# EAGLE design TA7358A (EAGLE 9.6.2)
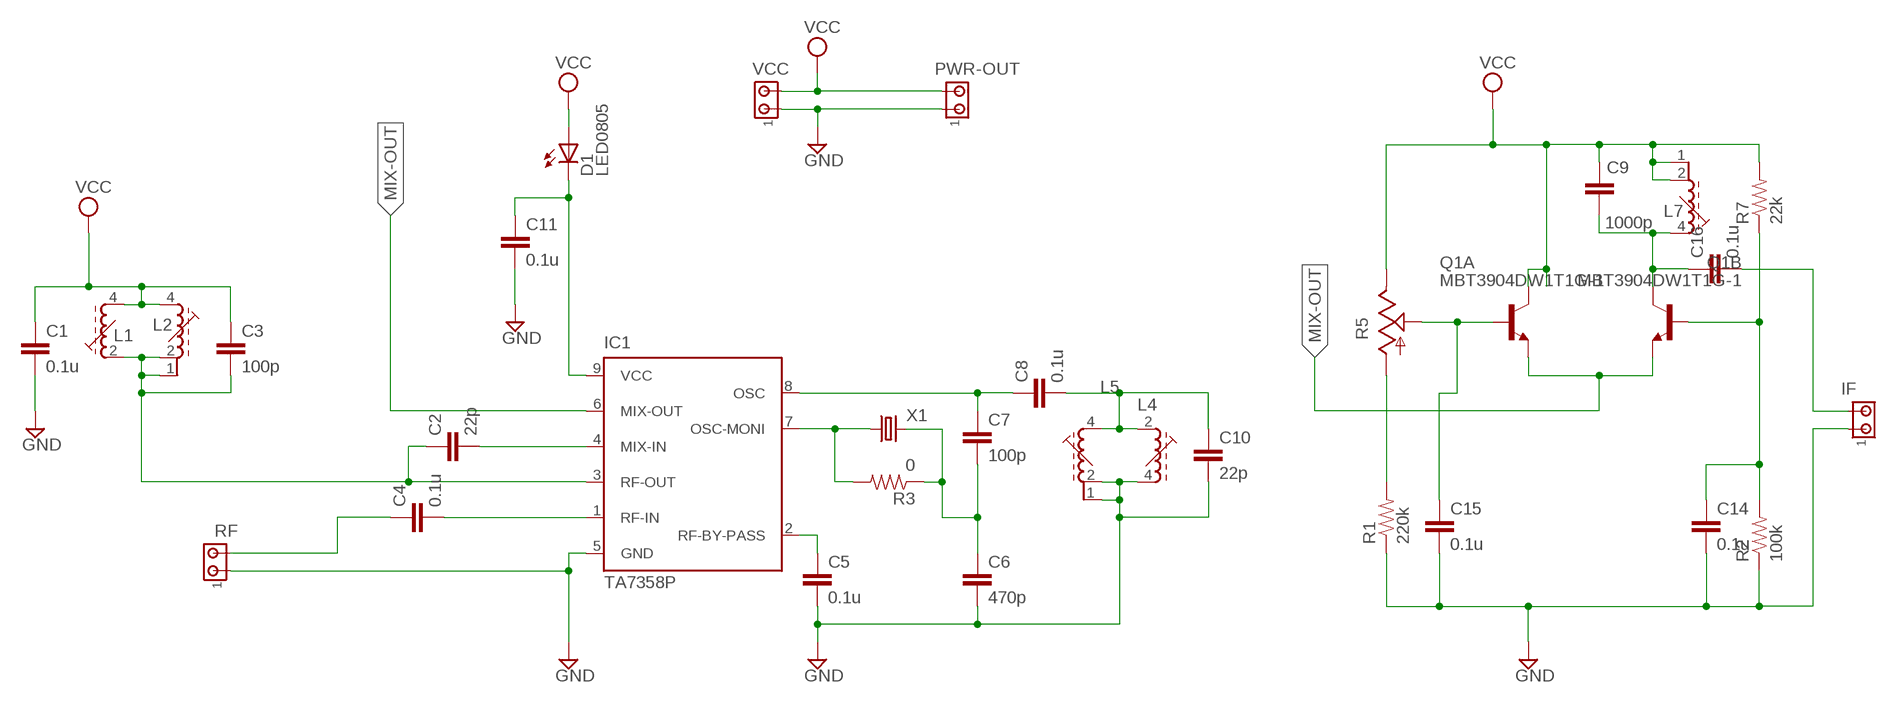
[diagram p0: schematic, sheet 1]

## Parts
C1  0.1u  CAPACITOR-NP0805  [0805]
C2  22p  CAPACITOR-NP0805  [0805]
C3  100p  CAPACITOR-NP0.2"  [CAP-0.2]
C4  0.1u  CAPACITOR-NP0805  [0805]
C5  0.1u  CAPACITOR-NP0805  [0805]
C6  470p  CAPACITOR-NP0.2"  [CAP-0.2]
C7  100p  CAPACITOR-NP0.2"  [CAP-0.2]
C8  0.1u  CAPACITOR-NP0805  [0805]
C9  1000p  CAPACITOR-NP0.2"  [CAP-0.2]
C10  22p  CAPACITOR-NP0.2"  [CAP-0.2]
C11  0.1u  CAPACITOR-NP0805  [0805]
C14  0.1u  CAPACITOR-NP0805  [0805]
C15  0.1u  CAPACITOR-NP0805  [0805]
C16  0.1u  CAPACITOR-NP0805  [0805]
D1  LED0805  [0805]
IC1  TA7358P  [SIP9-P-2.54A]
IF  BERG-2  [BERG-2]
L1  INDUCTOR-VAR-TOKO5K  [TOKO5K]
L2  INDUCTOR-VAR271K2  [71K2]
L4  INDUCTOR-VAR-TOKO5K  [TOKO5K]
L5  INDUCTOR-VAR271K2  [71K2]
L7  INDUCTOR-VAR271K2  [71K2]
PWR-OUT  BERG-2  [BERG-2]
Q1  MBT3904DW1T1G-1  [SOT363]
R1  220k  RESISTOR0805-RES  [0805]
R2  100k  RESISTOR0805-RES  [0805]
R3  0  RESISTOR0805-RES  [0805]
R5  100k  TRIMPOT-RM065  [RM-065]
R7  22k  RESISTOR0805-RES  [0805]
RF  BERG-2  [BERG-2]
VCC  BERG-2  [BERG-2]
X1  CRYSTALHC49S  [HC49/S]

## Nets
GND: C1.2 C5.2 C6.2 C10.2 C11.2 C14.2 C15.2 IC1.5(GND) IF.1 L4.4(E) L5.1(E1) L5.2(E) PWR-OUT.1 R1.1 R2.1 RF.1 VCC.1
MIX-OUT: IC1.6(MIX-OUT) Q1.1(B:E) Q1.4(A:E)
N$1: C2.2 IC1.4(MIX-IN)
N$2: C4.2 IC1.1(RF-IN)
N$3: C2.1 C3.2 IC1.3(RF-OUT) L1.2(A) L2.1(E1) L2.2(E)
N$5: C4.1 RF.2
N$6: C5.1 IC1.2(RF-BY-PASS)
N$7: C16.2 IF.2
N$8: C7.1 C8.1 IC1.8(OSC)
N$9: IC1.7(OSC-MONI) R3.2 X1.1
N$10: C6.1 C7.2 R3.1 X1.2
N$11: C14.1 Q1.2(B:B) R2.2 R7.1
N$12: R1.2 R5.CCW
N$13: C11.1 D1.1(C) IC1.9(VCC)
N$17: C9.2 C16.1 L7.4(A) Q1.6(B:C)
N$20: C15.1 Q1.5(A:B) R5.CT
VCC: C1.1 C3.1 C9.1 D1.2(A) L1.4(E) L2.4(A) L7.1(E1) L7.2(E) PWR-OUT.2 Q1.3(A:C) R5.CW R7.2 VCC.2
VCC1: C8.2 C10.1 L4.2(A) L5.4(A)

## Library data of the parts
C1-C11 C14-C16 = madhu:CAPACITOR-NP: Non-polarized capacitor 0.1", 0.2" leaded capacitor.
D1 = madhu:LED: LED
IC1 = linear:TA7358P: FM FRONT-END Source: TOSHIBA TA7358P.pdf
IF PWR-OUT RF VCC = madhu:BERG-2: Two pin Berg connector
L1 L4 = madhu:INDUCTOR-VAR: Variable inductors
L2 L5 L7 = madhu:INDUCTOR-VAR2: 7K and MC-122 combined inductor. Externally connect pins 1 and 2
Q1 = madhu:MBT3904DW1T1G: Dual NPN 150 mW, 300 MHz ft
R1-R3 R7 = madhu:RESISTOR: Resistor Basic schematic elements and footprints for 0603, 1206, and PTH resistors.
R5 = madhu:TRIMPOT: Trimer potentiometer
X1 = madhu:CRYSTAL: CRYSTAL; OC_FARNELL: 1667008; OC_NEWARK: unknown

## Board
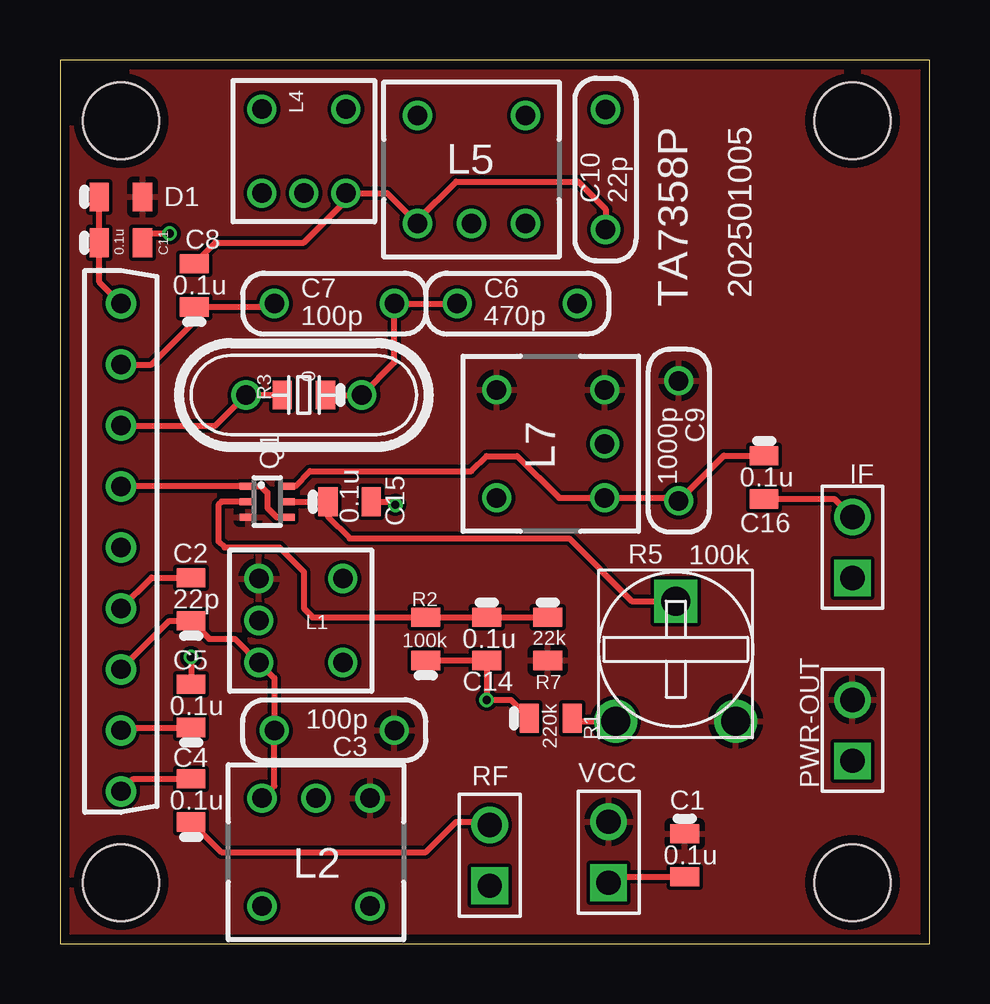
[diagram p1: board, top side]
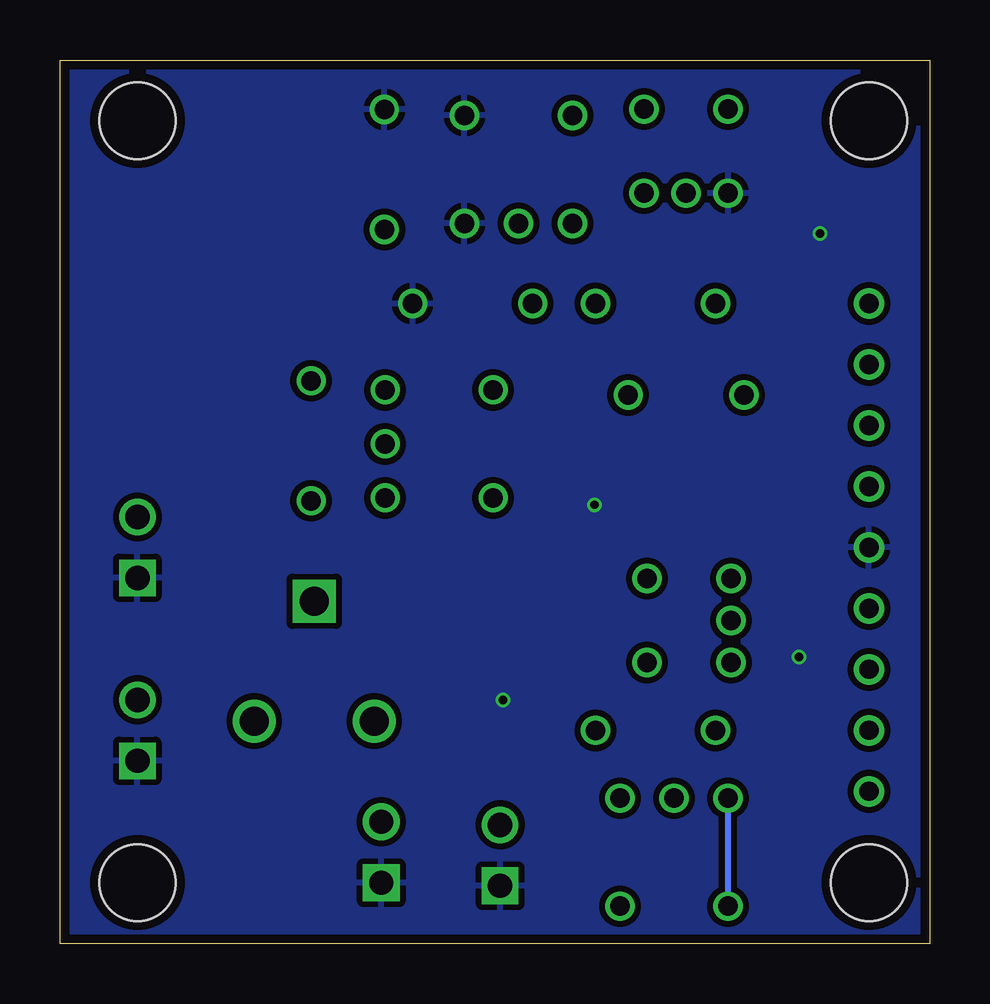
[diagram p2: board, bottom side, seen from below]

Size 36.25 x 36.82 mm. Coordinates in mm from the lower left corner, seen from the top.
Outline: 0,0 36.25,0 36.25,36.82 0,36.82 0,0
Copper layers (1*16): Top 0.035559375mm / dielectric 1.6mm / Bottom 0.035559375mm
Design rules "oshpark-2layer": minimum track width 6mil, minimum drill 10mil, track to track 6mil, track to pad 6mil, pad to pad 6mil, via to via 6mil, smd to smd 6mil, copper to edge 15mil, drill to drill 6mil, minimum pad ring 5mil, minimum via ring 5mil, stop-mask expansion 2.5mil, vias tented up to drill 0mil, thermal gap 10mil
Holes 3.17 mm at 2.54,2.54 33.02,2.54 2.54,34.29 33.02,34.29

### Footprints (pad centres in the part's own frame; a part is rotated, then mirrored left to right if it is on the bottom)
0805 = smd 0.8 x 1.2: 1 -0.9,0; 2 0.9,0
CAP-0.2 = drill 0.813: 1 -2.5,0; 2 2.5,0
SIP9-P-2.54A = drill 0.8 pad 1.27: 1 -10.16,0; 2 -7.62,0; 3 -5.08,0; 4 -2.54,0; 5 0,0; 6 2.54,0; 7 5.08,0; 8 7.62,0; 9 10.16,0
BERG-2 = drill 1.016 square: 1 -1.27,0 | drill 1.016: 2 1.27,0
TOKO5K = drill 0.813: 1 -1.75,1.75; 2 1.75,1.75; 3 1.75,0; 4 1.75,-1.75; 5 -1.75,-1.75
71K2 = drill 0.813: 1 -2.25,-2.25; 2 -2.25,2.25; 3 0,2.25; 4 2.25,2.25; 5 2.25,-2.25
SOT363 = smd 0.3 x 0.7: 1 -0.65,-0.8; 2 0,-0.8; 3 0.65,-0.8; 4 0.65,0.8; 5 0,0.8; 6 -0.65,0.8
RM-065 = drill 1.2: CCW -2.5,0; CW 2.5,0 | drill 1.2 square: CT 0,5
HC49/S = drill 0.813: 1 -2.413,0; 2 2.413,0

### Placement (x,y rotation side)
C1  26.04,3.68 270 top
C2  5.46,14.35 90 top
C3  11.43,8.89 180 top
C4  5.46,5.97 90 top
C5  5.46,9.91 90 top
C6  19.05,26.67 0 top
C7  11.43,26.67 0 top
C8  5.59,27.43 90 top
C9  25.78,20.95 270 top
C10  22.73,32.26 90 top
C11  2.54,29.21 0 top
C14  17.78,12.7 270 top
C15  12.06,18.41 0 top
C16  29.34,19.43 270 top
D1  2.54,31.11 0 top
IC1  2.54,16.51 90 top
IF  33.02,16.51 90 top
L1  10.03,13.46 180 top
L2  10.67,3.81 0 top
L4  10.16,33.02 270 top
L5  17.14,32.26 180 top
L7  20.45,20.83 270 top
PWR-OUT  33.02,8.89 90 top
Q1  8.64,18.41 270 top
R1  20.45,9.4 0 top
R2  15.24,12.7 90 top
R3  10.16,22.86 180 top
R5  25.65,9.27 0 top
R7  20.32,12.7 270 top
RF  17.91,3.68 90 top
VCC  22.86,3.81 90 top
X1  10.16,22.86 0 top

### Tracks (layer width: path | path; a pad name or v marks a point on that pad's centre or on a via)
GND  (via drill 0.35)
  Top 0.254: R2.1 C14.2 v17.78,10.16 18.79,10.16 R1.1 | VCC.1 23.1,2.78 C1.2 | v5.46,11.94 C5.2 | C11.2 3.82,29.59 v4.57,29.59 | C15.2 13.84,18.41 v13.97,18.29
  pour Bottom (isolate 0.254): 0,0 0,36.7 36.32,36.7 36.32,0
MIX-OUT
  Top 0.254: IC1.6 7.82,19.05 Q1.1 8.37,19.07 8.64,18.8 8.64,18.16 9.03,17.77 Q1.4
N$1
  Top 0.254: IC1.4 3.82,15.25 C2.2
N$2
  Top 0.254: IC1.1 3.06,6.87 C4.2
N$3
  Top 0.254: IC1.3 4.56,13.45 C2.1 6.21,12.7 7.29,12.7 L1.2 8.93,11.06 C3.2 8.93,6.57 L2.2
  Bottom 0.254: L2.2 L2.1
N$5
  Top 0.254: C4.1 6.72,3.81 15.24,3.81 16.51,5.08 17.78,5.08 RF.2
N$6
  Top 0.254: IC1.2 2.66,9.01 C5.1
N$7
  Top 0.254: C16.2 32.27,18.53 IF.2
N$8
  Top 0.254: IC1.8 3.81,24.13 5.59,25.91 C8.1 8.79,26.53 C7.1
N$9
  Top 0.254: IC1.7 6.48,21.59 X1.1 R3.2
N$10
  Top 0.254: C6.1 C7.2 13.93,24.22 X1.2 R3.1
N$11
  Top 0.254: Q1.2 6.73,18.41 6.6,18.29 6.6,16.76 6.86,16.51 9.14,16.51 10.16,15.49 10.16,13.97 10.53,13.6 R2.2 C14.1 R7.1
N$12
  Top 0.254: R1.2 21.47,9.27 R5.CCW
N$13
  Top 0.254: IC1.9 1.64,27.57 C11.1 D1.1
N$17
  Top 0.254: Q1.6 9.79,19.07 10.41,19.68 17.14,19.68 17.78,20.32 19.05,20.32 20.79,18.58 L7.4 25.66,18.58 C9.2 27.66,20.33 C16.1
N$20
  Top 0.254: R5.CT 23.83,14.27 21.21,16.89 12.06,16.89 11.16,17.79 C15.1 Q1.5
VCC
  pour Top: 0,0 0,36.83 36.83,36.83 36.83,0
VCC1
  Top 0.254: C8.2 6.47,29.21 10.16,29.21 11.91,30.96 L4.2 13.63,31.27 L5.4 14.89,30.14 16.51,31.75 21.59,31.75 22.73,30.61 C10.1

### Text on the board
tNames: 202501005 | RF